# Altium schematic sheet Charging_Circuit.SchDoc
size A4; SheetNumber: 5; SheetTotal: 7
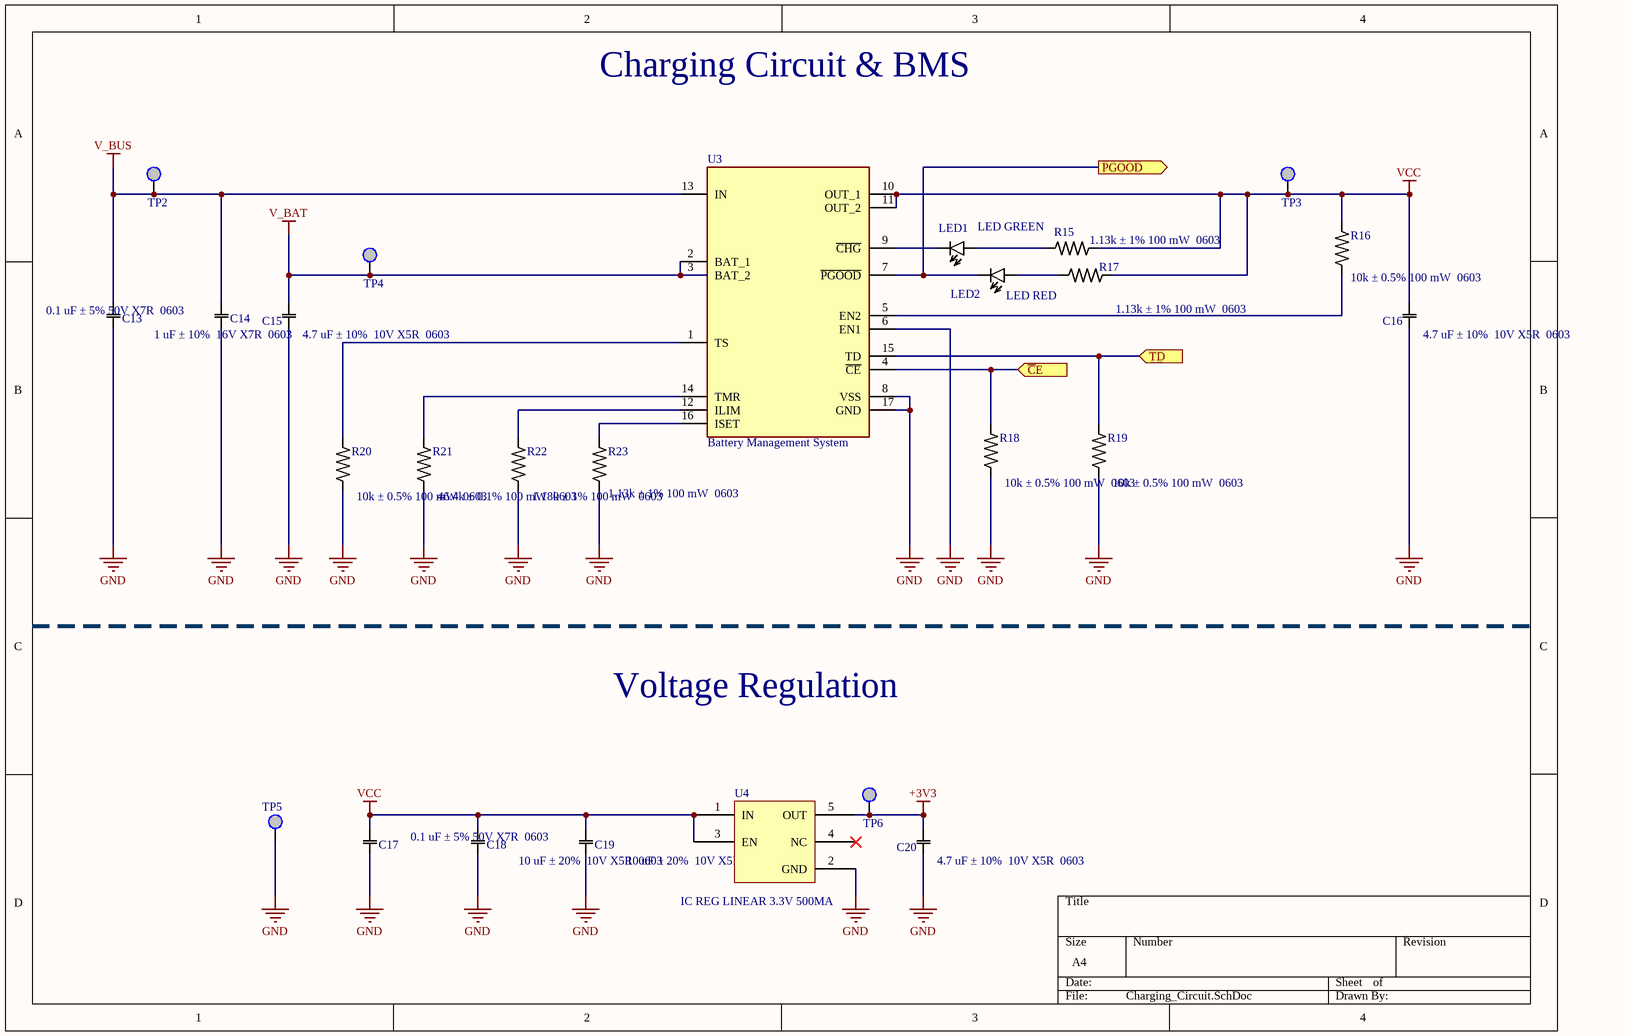
[diagram p0: Charging_Circuit.SchDoc]

## Parts
C13  0.1 uF ± 5% / 50V X7R / 0603  [0603_CAP]
C14  1 uF ± 10% / 16V X7R / 0603  [0603_CAP]
C15  4.7 uF ± 10% / 10V X5R / 0603  [0603_CAP]
C16  4.7 uF ± 10% / 10V X5R / 0603  [0603_CAP]
C17  0.1 uF ± 5% / 50V X7R / 0603  [0603_CAP]
C18  10 uF ± 20% / 10V X5R / 0603  [0603_CAP]
C19  10 uF ± 20% / 10V X5R / 0603  [0603_CAP]
C20  4.7 uF ± 10% / 10V X5R / 0603  [0603_CAP]
LED1  LED GREEN  [LED]
LED2  LED RED  [LED]
R15  1.13k ± 1% / 100 mW / 0603  [0603_RES]
R16  10k ± 0.5% / 100 mW / 0603  [0603_RES]
R17  1.13k ± 1% / 100 mW / 0603  [0603_RES]
R18  10k ± 0.5% / 100 mW / 0603  [0603_RES]
R19  10k ± 0.5% / 100 mW / 0603  [0603_RES]
R20  10k ± 0.5% / 100 mW / 0603  [0603_RES]
R21  46.4k ± 0.1% / 100 mW / 0603  [0603_RES]
R22  1.18k ± 1% / 100 mW / 0603  [0603_RES]
R23  1.13k ± 1% / 100 mW / 0603  [0603_RES]
TP2  TEST POINT  [New footprint 1]  (value not drawn)  (no BOM)
TP3  TEST POINT  [New footprint 1]  (value not drawn)  (no BOM)
TP4  TEST POINT  [New footprint 1]  (value not drawn)  (no BOM)
TP5  TEST POINT  [New footprint 1]  (value not drawn)  (no BOM)
TP6  TEST POINT  [New footprint 1]  (value not drawn)  (no BOM)
U3  Battery Management System  [BQ24074RGTR]
U4  IC REG LINEAR 3.3V 500MA  [SOT23-5]

## Ports
PGOOD (out, see Game_Controller[3C]), TD (in, see Game_Controller[3C]), ~{C}E (in, see Game_Controller[3C])

## Nets
+3V3: C20.1 TP6.0 U4.5(OUT)
GND: C13.2 C14.2 C15.2 C16.2 C17.2 C18.2 C19.2 C20.2 R18.1 R19.1 R20.1 R21.2 R22.1 R23.1 TP5.0 U3.6(EN1) U3.8(VSS) U3.17(GND) U4.2(GND)
V_BAT: C15.1 TP4.0 U3.2(BAT_1) U3.3(BAT_2)
V_BUS: C13.1 C14.1 TP2.0 U3.13(IN)
VCC: C16.1 C17.1 C18.1 C19.1 R15.1 R16.1 R17.1 TP3.0 U3.10(OUT_1) U3.11(OUT_2) U4.1(IN) U4.3(EN)
~{C}E: R18.2 U3.4(~{CE}) ; port ~{C}E
PGOOD: LED2.2(K) U3.7(~{PGOOD}) ; port PGOOD
TD: R19.2 U3.15(TD) ; port TD
NetLED1_1: LED1.1(A) R15.2
NetLED1_2: LED1.2(K) U3.9(~{CHG})
NetLED2_1: LED2.1(A) R17.2
NetR16_2: R16.2 U3.5(EN2)
NetR20_2: R20.2 U3.1(TS)
NetR21_1: R21.1 U3.14(TMR)
NetR22_2: R22.2 U3.12(ILIM)
NetR23_2: R23.2 U3.16(ISET)

Not connected (* = marked no-connect by the designer): U4 4(NC)*

## Notes on the sheet
- Charging Circuit & BMS
- Voltage Regulation

## Library data of the parts
C13 C17 = 3: Manufacturer: Yageo; Manufacturer Part Number: CC0603JRX7R9BB104; CID: 3
C14 = 5: Manufacturer: Yageo; Manufacturer Part Number: GXT188R71C105KE13D; CID: 5
C15 C16 C20 = 8: Manufacturer: Yageo; Manufacturer Part Number: CC0603KPX5R6BB475; CID: 8
C18 C19 = 14: Manufacturer: Murata; Manufacturer Part Number: GRM188R61A106ME69D; CID: 14
LED1 = 11: Manufacturer: Lite-ON; Manufacturer Part Number: LTST-C190GKT; CID: 11
LED2 = 12: Manufacturer: Lite-ON; Manufacturer Part Number: LTST-C190KRKT; CID: 12
R15 R17 R23 = 10: Manufacturer: Yageo; Manufacturer Part Number: RC0603FR-071K13L; CID: 10
R16 R18-R20 = 6: Manufacturer: Yageo; Manufacturer Part Number: AC0603DRE0710KL; CID: 6
R21 = 7: Manufacturer: Yageo; Manufacturer Part Number: RT0603BRD0746K4L; CID: 7
R22 = 9: Manufacturer: Yageo; Manufacturer Part Number: RC0603FR-071K18L; CID: 9
TP2-TP6 = CMP-008-000007-2: 1mm Test Point
U3 = 2: Manufacturer: Texas Instrument; CID: 2; Manufacturer Part Number: BQ24074RGTR
U4 = 13: Manufacturer: Texas Instrument; CID: 13; Manufacturer Part Number: TLV75533PDBVR